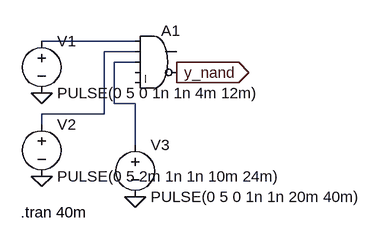
[diagram p0: schematic nand_gate.asc]
nand_gate.asc, the LTspice schematic file:
Version 4.1
SHEET 1 880 680
WIRE 144 64 0 64
WIRE 144 80 96 80
WIRE 144 96 112 96
WIRE 112 160 112 96
WIRE 144 160 112 160
WIRE 96 176 96 80
WIRE 96 176 0 176
WIRE 0 192 0 176
WIRE 144 224 144 160
FLAG 208 112 y_nand
IOPIN 208 112 Out
FLAG 0 144 0
FLAG 0 272 0
FLAG 144 304 0
SYMBOL voltage 0 48 R0
WINDOW 123 0 0 Left 2
WINDOW 39 0 0 Left 2
SYMATTR InstName V1
SYMATTR Value PULSE(0 5 0 1n 1n 4m 12m)
SYMBOL voltage 0 176 R0
WINDOW 123 0 0 Left 2
WINDOW 39 0 0 Left 2
SYMATTR InstName V2
SYMATTR Value PULSE(0 5 2m 1n 1n 10m 24m)
SYMBOL voltage 144 208 R0
WINDOW 123 0 0 Left 2
WINDOW 39 0 0 Left 2
SYMATTR InstName V3
SYMATTR Value PULSE(0 5 0 1n 1n 20m 40m)
SYMBOL Digital\\and 176 32 R0
SYMATTR InstName A1
TEXT -32 328 Left 2 !.tran 40m

The netlist it stands for:
* nand_gate.asc
V1 N001 0 PULSE(0 5 0 1n 1n 4m 12m)
V2 N002 0 PULSE(0 5 2m 1n 1n 10m 24m)
V3 N003 0 PULSE(0 5 0 1n 1n 20m 40m)
A1 N001 N002 N003 0 0 y_nand 0 0 AND
.tran 40m
.backanno
.end